# Altium schematic sheet Controller_Section.SchDoc
size A4; SheetNumber: 3; SheetTotal: 5
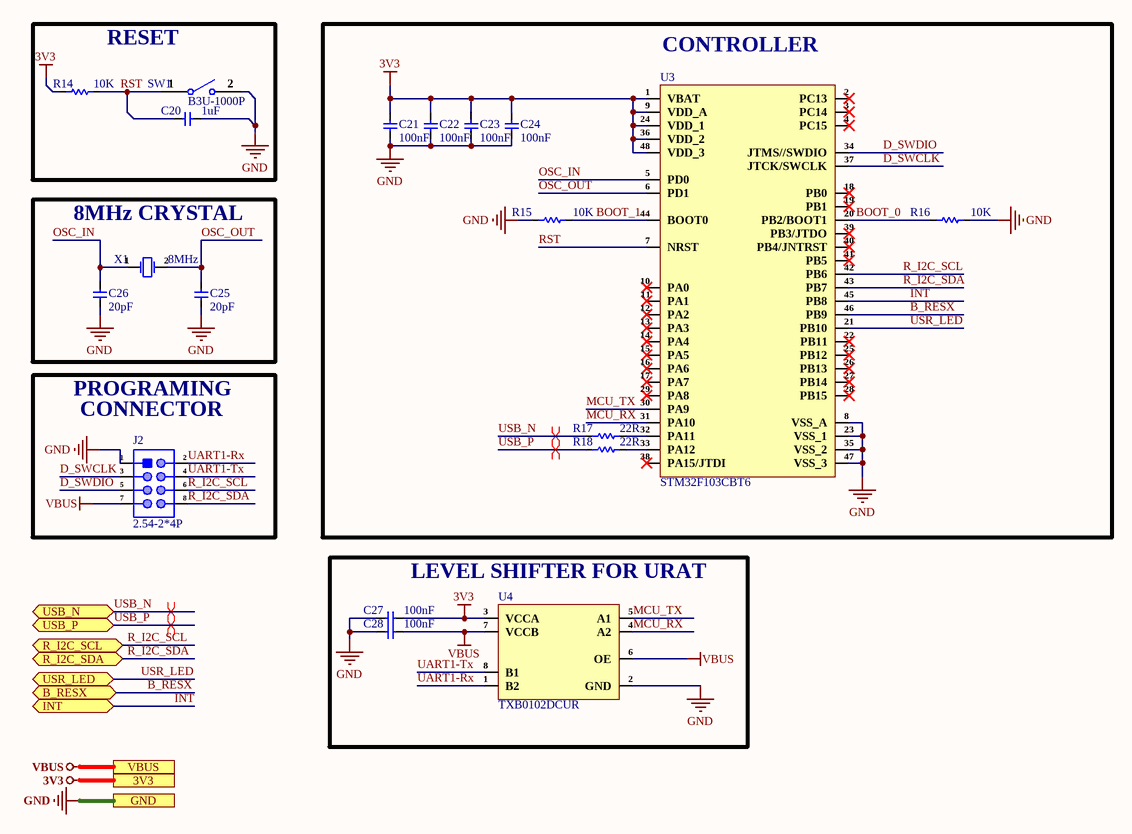
[diagram p0: Controller_Section.SchDoc]

## Parts
C20  1uF  [Cap-0603]
C21  100nF  [Cap-0603]
C22  100nF  [Cap-0603]
C23  100nF  [Cap-0603]
C24  100nF  [Cap-0603]
C25  20pF  [Cap-0603]
C26  20pF  [Cap-0603]
C27  100nF  [Cap-0603]
C28  100nF  [Cap-0603]
J2  2.54-2*4P  [C192300]
R14  10K  [Res-0603]
R15  10K  [Res-0603]
R16  10K  [Res-0603]
R17  22R  [Res-0603]
R18  22R  [Res-0603]
SW1  B3U-1000P  [B3U-1000P]
U3  STM32F103CBT6  [48-LQFP (7x7)_]
U4  TXB0102DCUR  [VSSOP-8(3.1x2.1)]
X1  8MHz  [SMD5032-2P]

## Blocks framed on the sheet
RESET: C20 R14 SW1
CONTROLLER: C21-C24 R15-R18 U3
8MHz CRYSTAL: C25 C26 X1
LEVEL SHIFTER FOR URAT: C27 C28 U4

## Ports
3V3 (see Top_Sheet[2B], HDMI_to_MIPI_Section[1D], Power_Section[3C]), B_RESX (bidir, see Top_Sheet[3B], HDMI_to_MIPI_Section[1C]), GND (see Top_Sheet[3B], Connector_Section[3C], HDMI_to_MIPI_Section[1D], Power_Section[3C]), INT (bidir, see Top_Sheet[3B], HDMI_to_MIPI_Section[1C]), R_I2C_SCL (bidir, see Top_Sheet[3B], HDMI_to_MIPI_Section[1C]), R_I2C_SDA (bidir, see Top_Sheet[3B], HDMI_to_MIPI_Section[1C]), USB_N (bidir, see Top_Sheet[2B], Power_Section[2C]), USB_P (bidir, see Top_Sheet[2B], Power_Section[2C]), USR_LED (bidir, see Top_Sheet[2B], Power_Section[2C]), VBUS (see Top_Sheet[2B], Connector_Section[3C], Power_Section[3C])

## Nets
3V3: C21.2 C22.2 C23.2 C24.2 C27.1 R14.1 U3.1(VBAT) U3.9(VDD_A) U3.24(VDD_1) U3.36(VDD_2) U3.48(VDD_3) U4.3(VCCA) ; port 3V3
GND: C20.2 C21.1 C22.1 C23.1 C24.1 C25.1 C26.1 C27.2 C28.2 J2.1 R15.1 R16.2 SW1.2 U3.8(VSS_A) U3.23(VSS_1) U3.35(VSS_2) U3.47(VSS_3) U4.2(GND) ; port GND
VBUS: C28.1 J2.7 U4.6(OE) U4.7(VCCB) ; port VBUS
B_RESX: U3.46(PB9) ; port B_RESX
BOOT_0: R16.1 U3.20(PB2/BOOT1)
BOOT_1: R15.2 U3.44(BOOT0)
D_SWCLK: J2.3 U3.37(JTCK/SWCLK)
D_SWDIO: J2.5 U3.34(JTMS//SWDIO)
INT: U3.45(PB8) ; port INT
MCU_RX: U3.31(PA10) U4.4(A2)
MCU_TX: U3.30(PA9) U4.5(A1)
OSC_IN: C26.2 U3.5(PD0) X1.1(OSC1)
OSC_OUT: C25.2 U3.6(PD1) X1.2(OSC2)
R_I2C_SCL: J2.6 U3.42(PB6) ; port R_I2C_SCL
R_I2C_SDA: J2.8 U3.43(PB7) ; port R_I2C_SDA
RST: C20.1 R14.2 SW1.1 U3.7(NRST)
UART1-Rx: J2.2 U4.1(B2)
UART1-Tx: J2.4 U4.8(B1)
USB_N: R17.1 ; port USB_N
USB_P: R18.1 ; port USB_P
USR_LED: U3.21(PB10) ; port USR_LED
NetR17_2: R17.2 U3.32(PA11)
NetR18_2: R18.2 U3.33(PA12)

Not connected (* = marked no-connect by the designer): U3 2(PC13)* 3(PC14)* 4(PC15)* 10(PA0)* 11(PA1)* 12(PA2)* 13(PA3)* 14(PA4)* 15(PA5)* 16(PA6)* 17(PA7)* 18(PB0)* 19(PB1)* 22(PB11)* 25(PB12)* 26(PB13)* 27(PB14)* 28(PB15)* 29(PA8)* 38(PA15/JTDI)* 39(PB3/JTDO)* 40(PB4/JNTRST)* 41(PB5)*

## Layout directives
differential pair; net class USB; differential pair class USB_Lines; rule Impedance Constraint [Min = 85.00    Max = 90.00    ]; rule Matched Net Lengths [Tolerance = 50mil]: USB_N, USB_P

## Notes on the sheet
- PROGRAMING
- (near J2) CONNECTOR
- File:
- Title:
- Date:
- Page
- Num:
- Total:
- Drawn By: Huzaifa Ali

## Library data of the parts
C20 = CL10A105KO8NNNC: 16V 1uF X5R ±10% 0603 Multilayer Ceramic Capacitors MLCC - SMD/SMT ROHS; Manufacturer: Samsung Electro-Mechanics; Manufacturer Part Number: CL10A105KO8NNNC; Package: 0603; LCSC Part Number: C1592; Item Type: Capacitor; ComponentLink1Description: LCSC; ComponentLink1URL: https://www.lcsc.com/product-detail/Multilayer-Ceramic-Capacitors-MLCC-SMD-SMT_Samsung-Electro-Mechanics-CL10A105KO8NNNC_C1592.html
C21-C24 C27 C28 = CL10B104KA8NNNC: 25V 100nF X7R ±10% 0603 Multilayer Ceramic Capacitors MLCC - SMD/SMT ROHS; Manufacturer: Samsung Electro-Mechanics; ComponentLink1Description: LCSC; ComponentLink1URL: https://www.lcsc.com/product-detail/Multilayer-Ceramic-Capacitors-MLCC-SMD-SMT_Samsung-Electro-Mechanics-CL10B104KA8NNNC_C1590.html; Manufacturer Part Number: CL10B104KA8NNNC; Package: 0603; LCSC Part Number: C1590; Item Type: Capacitor
C25 C26 = CC0603JRNPO9BN200: CAP CER 20PF 50V C0G/NPO 0603; Manufacturer: Yageo; Tolerance: 5%; Dielectric: C0G; Item Type: Capacitor; Supplier 1: Digi-Key; Manufacturer Part Number: CC0603JRNPO9BN200; Stock 1: 259568; Pricing 1: 1=0.1, 10=0.048, 100=0.0214, 500=0.01526, 1000=0.01198 (USD); Mount: Surface Mount; Case/Package: 0603; Number of Pins: 2; Weight: 7.1E-05oz; Case Code (Imperial): 0603; Case Code (Metric): 1608; Min Operating Temperature: -55°C; Max Operating Temperature: 125°C; Capacitance: 20pF; Package Quantity: 4000; Voltage Rating (DC): 50V; Packaging: Tape and Reel; Voltage Rating: 50V; Termination: SMD/SMT; Composition: Ceramic; Length: 1.6mm; Width: 0.8mm; Thickness: 0.035inch; Depth: 0.8mm; REACH SVHC: Unknown; Lead Free: Lead Free; ComponentLink1URL: http://www.farnell.com/datasheets/1132289.pdf?src-supplier=Element14; ComponentLink1Description: http://www.farnell.com/datasheets/1132289.pdf?src-supplier=Element14; ComponentLink2URL: http://www.yageo.com/documents/recent/UPY-GP_NP0_16V-to-50V_16.pdf?src-supplier=Digi-Key; ComponentLink2Description: http://www.yageo.com/documents/recent/UPY-GP_NP0_16V-to-50V_16.pdf?src-supplier=Digi-Key; Supplier Part Number 1: 311-1424-6-ND; LCSC Part Number: C105621
J2 = 2.54-2*4P: 3A Brick nogging Square Pins 2.5mm 8P 6mm -55℃~+105℃ 2.54mm 双排 Black 2x4P 2.54mm SMD,P=2.54mm Pin Headers ROHS; Manufacturer: BOOMELE(BOOM Precision Elec); Item Type: Male; Manufacturer Part Number: 2.54-2*4P; Package: SMD,P=2.54mm; LCSC Part Number: C192300; ComponentLink1Description: LCSC; ComponentLink1URL: https://www.lcsc.com/product-detail/Pin-Headers_BOOMELE-Boom-Precision-Elec-C192300_C192300.html
R14-R16 = 0603WAF1002T5E: 100mW Thick Film Resistors 75V ±100ppm/℃ ±1% 10kΩ 0603 Chip Resistor - Surface Mount ROHS; Manufacturer: UNI-ROYAL(Uniroyal Elec); Manufacturer Part Number: 0603WAF1002T5E; Value: 10K; Package: 0603; ComponentLink1Description: LCSC; ComponentLink1URL: https://www.lcsc.com/product-detail/Chip-Resistor-Surface-Mount_UNI-ROYAL-Uniroyal-Elec-0603WAF1002T5E_C25804.html; LCSC Part Number: C25804; Item Type: Resistor
R17 R18 = 0603WAF220JT5E: 100mW Thick Film Resistors 75V ±100ppm/℃ ±1% 22Ω 0603 Chip Resistor - Surface Mount ROHS; Manufacturer: UNI-ROYAL(Uniroyal Elec); Manufacturer Part Number: 0603WAF220JT5E; Value: 22R; Footprint: 0603; ComponentLink1Description: LCSC; ComponentLink1URL: https://www.lcsc.com/product-detail/Chip-Resistor-Surface-Mount_UNI-ROYAL-Uniroyal-Elec-0603WAF220JT5E_C23345.html; LCSC Part Number: C23345; Item Type: Resistor
SW1 = B3U-1000P: SWITCH TACTILE SPST-NO 0.05A 12V; Manufacturer: Omron; Mechanical Life: 200000Cycles; Operating Force: 1.5N; Throw Configuration: SPST; Current Rating: 50mA; Contact Resistance: 100mR; Illumination Type: Non-Illuminated,Illuminated; Switch Travel: 0.15mm; Switch Function: Off-Mom; Actuator Type: Standard; Actuator Length: 0.4mm; Ratings: Dust Proof,IP40; ComponentLink1URL: http://www.farnell.com/datasheets/60838.pdf?src-supplier=Farnell; ComponentLink1Description: http://www.farnell.com/datasheets/60838.pdf?src-supplier=Farnell; ComponentLink2URL: http://www.farnell.com/datasheets/60838.pdf?src-supplier=Element14; ComponentLink2Description: http://www.farnell.com/datasheets/60838.pdf?src-supplier=Element14; ComponentLink3URL: https://omronfs.omron.com/en_US/ecb/products/pdf/en-b3u.pdf?src-supplier=Digi-Key; ComponentLink3Description: https://omronfs.omron.com/en_US/ecb/products/pdf/en-b3u.pdf?src-supplier=Digi-Key; ComponentLink4URL: http://www.omron.com/ecb/products/pdf/en-b3u.pdf?src-supplier=Digi-Key; ComponentLink4Description: http://www.omron.com/ecb/products/pdf/en-b3u.pdf?src-supplier=Digi-Key; ComponentLink5URL: https://www.distrelec.biz/Web/Downloads/he/et/B3U_eng_datasheet.pdf?mime=application%2Fpdf&src-supplier=Distrelec; ComponentLink5Description: https://www.distrelec.biz/Web/Downloads/he/et/B3U_eng_datasheet.pdf?mime=application%2Fpdf&src-supplier=Distrelec; ComponentLink6URL: http://www.onlinecomponents.com/productFiles/mf-OM/en-b3u.pdf?src-supplier=Onlinecomponents.com; ComponentLink6Description: http://www.onlinecomponents.com/productFiles/mf-OM/en-b3u.pdf?src-supplier=Onlinecomponents.com; Supplier 1: Digi-Key; Manufacturer Part Number: B3U-1000P; Stock 1: 116454; Pricing 1: 1=1, 10=0.961, 25=0.9064, 50=0.7976, 100=0.7251, 250=0.68888, 500=0.67074, 1000=0.52571 (USD); Mount: Surface Mount; Weight: 0.000776oz; Contact Material: Silver; Min Operating Temperature: -25°C; Max Operating Temperature: 70°C; Packaging: Tape and Reel; Voltage Rating (DC): 12V; Package Quantity: 1; Max Current Rating: 50mA; Termination: SMD/SMT; Orientation: Straight; Max Voltage Rating (DC): 12V; Electrical Life: 200000Cycles; Insulation Resistance: 100MR; Contact Current Rating: 50mA; Length: 4mm; Height: 1.2mm; Depth: 2.5mm; Width: 3mm; REACH SVHC: Unknown; Lead Free: Lead Free; ComponentLink7URL: https://www.verical.com/server-webapp/html/getDatasheet?partID=552554&src-supplier=Verical; ComponentLink7Description: https://www.verical.com/server-webapp/html/getDatasheet?partID=552554&src-supplier=Verical; ComponentLink8URL: http://www.farnell.com/datasheets/1685550.pdf?src-supplier=Element14; ComponentLink8Description: http://www.farnell.com/datasheets/1685550.pdf?src-supplier=Element14; ComponentLink9URL: http://www.farnell.com/datasheets/2610940.pdf?src-supplier=Farnell; ComponentLink9Description: http://www.farnell.com/datasheets/2610940.pdf?src-supplier=Farnell; ComponentLink10URL: https://www.alliedelec.com/m/d/4c8a9ef82804fc3c241a13c1e298fd73.pdf?src-supplier=Allied+Electronics; ComponentLink10Description: https://www.alliedelec.com/m/d/4c8a9ef82804fc3c241a13c1e298fd73.pdf?src-supplier=Allied+Electronics; Supplier Part Number 1: SW1020DKR-ND; LCSC Part Number: C231329; Item Type: Switch
U3 = STM32F103CBT6: IC MCU 32BIT 128KB FLASH 48LQFP; Manufacturer: STMicroelectronics; RAM Size: 20KB; Max Power Dissipation: 363mW; Interface: I2C,SPI,USB,CAN,IrDA,UART,USART,LIN; Number of I/Os: 37; Number of Timers/Counters: 4; Max Supply Voltage: 3.6V; Number of PWM Channels: 12; Frequency: 72MHz; Number of ADC Channels: 10; Min Supply Voltage: 2V; Oscillator Type: Internal; Data Bus Width: 32b; Number of Bits: 32; Number of SPI Channels: 2; Watchdog Timer: Yes; Peripherals: POR,PWM,WDT,DMA,Temp Sensor,I2C; Core Architecture: ARM; Supplier: Mouser; Supplier Part Number: 511-STM32F103CBT6; Manufacturer Part Number: STM32F103CBT6; RoHS: Yes; Category: Microcontrollers; Stock: 3552; Pricing: 1=7.35, 10=6.65, 50=5.53, 100=5.49, 1000=4.31, 10000=4.25 (USD); Case/Package: LQFP; Pins: 48; Min Operating Temperature: -40°C; Max Operating Temperature: 85°C; Package Quantity: 250; Density: 128KB; Packaging: Tray; Number of Programmable I/O: 37; Clock Frequency: 72MHz; Number of I2C Channels: 2; Memory Format: FLASH; Termination: SMD/SMT; Address Bus Width: 32b; Memory Size: 128KB; Series: STM32 F1; Length: 7mm; Width: 7.2mm; Height: 1.45mm; Radiation Hardening: No; Reach SVHC Compliant: No; Lead Free: Lead Free; RoHS Compliant: Yes; ComponentLink1URL: https://datasheet.ciiva.com/23669/1714663-23669200.pdf?src-supplier=Newark; ComponentLink1Description: https://datasheet.ciiva.com/23669/1714663-23669200.pdf?src-supplier=Newark; ComponentLink2URL: https://datasheet.ciiva.com/15122/getdatasheetpartid-92132-15122195.pdf?src-supplier=Verical; ComponentLink2Description: https://datasheet.ciiva.com/15122/getdatasheetpartid-92132-15122195.pdf?src-supplier=Verical; ComponentLink3URL: https://datasheet.ciiva.com/5752/cd00161566-5752838.pdf?src-supplier=Farnell; ComponentLink3Description: https://datasheet.ciiva.com/5752/cd00161566-5752838.pdf?src-supplier=Farnell; ComponentLink4URL: https://datasheet.ciiva.com/14100/pustm-arm-microcont-stm32f103-en-14100509.pdf?src-supplier=Distrelec; ComponentLink4Description: https://datasheet.ciiva.com/14100/pustm-arm-microcont-stm32f103-en-14100509.pdf?src-supplier=Distrelec; ComponentLink5URL: https://datasheet.ciiva.com/1502/cd00161566-1502328.pdf?src-supplier=Digi-Key; ComponentLink5Description: https://datasheet.ciiva.com/1502/cd00161566-1502328.pdf?src-supplier=Digi-Key; ComponentLink6URL: https://datasheet.ciiva.com/4840/cd00161566-4840398.pdf?src-supplier=Mouser; ComponentLink6Description: https://datasheet.ciiva.com/4840/cd00161566-4840398.pdf?src-supplier=Mouser; ComponentLink7URL: https://datasheet.ciiva.com/16219/cd00161566-16219150.pdf?src-supplier=Future+Electronics; ComponentLink7Description: https://datasheet.ciiva.com/16219/cd00161566-16219150.pdf?src-supplier=Future+Electronics; Item Type: IC; LCSC Part Number: C8304
U4 = TXB0102DCUR: IC TRANSLTR BIDIRECTIONAL 8VSSOP; Manufacturer: Texas Instruments; Number of Circuits: 1; Nominal Supply Current: 3.5uA; Number of Inputs: 1NUMBER; Max Supply Voltage: 5.5V; Min Supply Voltage: 1.2V; Propagation Delay: 7.4ns; Data Rate: 100Mbps; Logic Function: Translator; Number of Bits: 2; Turn-On Delay Time: 31ns; High Level Output Current: -20uA; Low Level Output Current: 20uA; Output Type: 3-STATE; Supplier: Digikey; Supplier Part Number: 296-22862-1-ND; Manufacturer Part Number: TXB0102DCUR; RoHS: Yes; Category: Voltage Level Shifters; Stock: 10593; Pricing: 1=0.69, 10=0.606, 25=0.5696, 100=0.4649, 250=0.4318, 500=0.36748, 1000=0.29398 (USD); Mounting Technology: Surface Mount; Case/Package: VSSOP; Pins: 8; Weight: 0.000339oz; Min Operating Temperature: -40°C; Max Operating Temperature: 85°C; Number of Outputs: 1NUMBER; Packaging: Tape and Reel; Package Quantity: 3000; Series: -; Channel Type: Bidirectional; Length: 2.3mm; Width: 2mm; Height: 900um; Thickness: 850um; Radiation Hardening: No; Reach SVHC Compliant: No; Lead Free: Lead Free; RoHS Compliant: Yes; ComponentLink1URL: https://datasheet.ciiva.com/7744/1634161-7744195.pdf?src-supplier=Element14; ComponentLink1Description: https://datasheet.ciiva.com/7744/1634161-7744195.pdf?src-supplier=Element14; ComponentLink2URL: https://datasheet.ciiva.com/22677/1699360-22677930.pdf?src-supplier=Element14; ComponentLink2Description: https://datasheet.ciiva.com/22677/1699360-22677930.pdf?src-supplier=Element14; ComponentLink3URL: https://datasheet.ciiva.com/4226/sces641b-4226960.pdf?src-supplier=Arrow+Electronics; ComponentLink3Description: https://datasheet.ciiva.com/4226/sces641b-4226960.pdf?src-supplier=Arrow+Electronics; ComponentLink4URL: https://datasheet.ciiva.com/15096/getdatasheetpartid-214907-15096235.pdf?src-supplier=Verical; ComponentLink4Description: https://datasheet.ciiva.com/15096/getdatasheetpartid-214907-15096235.pdf?src-supplier=Verical; ComponentLink5URL: https://datasheet.ciiva.com/6132/txb0102-6132717.pdf?src-supplier=Farnell; ComponentLink5Description: https://datasheet.ciiva.com/6132/txb0102-6132717.pdf?src-supplier=Farnell; ComponentLink6URL: https://datasheet.ciiva.com/46384/1874809-46384198.pdf?src-supplier=Element14; ComponentLink6Description: https://datasheet.ciiva.com/46384/1874809-46384198.pdf?src-supplier=Element14; ComponentLink7URL: https://datasheet.ciiva.com/1899/txb0102-1899430.pdf?src-supplier=Digikey; ComponentLink7Description: https://datasheet.ciiva.com/1899/txb0102-1899430.pdf?src-supplier=Digikey; ComponentLink8URL: https://datasheet.ciiva.com/1899/txb0102-1899429.pdf?src-supplier=Digikey; ComponentLink8Description: https://datasheet.ciiva.com/1899/txb0102-1899429.pdf?src-supplier=Digikey; ComponentLink9URL: https://datasheet.ciiva.com/1899/txb0102-1899431.pdf?src-supplier=Digikey; ComponentLink9Description: https://datasheet.ciiva.com/1899/txb0102-1899431.pdf?src-supplier=Digikey; ComponentLink10URL: https://datasheet.ciiva.com/14287/txb0102-14287496.pdf?src-supplier=Avnet; ComponentLink10Description: https://datasheet.ciiva.com/14287/txb0102-14287496.pdf?src-supplier=Avnet; LCSC Part Number: C60709; Type: IC; ComponentLink11Description: LCSC; ComponentLink11URL: https://www.lcsc.com/product-detail/Translators-Level-Shifters_Texas-Instruments-TXB0102DCUR_C60709.html
X1 = X50328MSB2GI: 8MHz 20pF ±10ppm ±50ppm SMD5032-2P Crystals ROHS; Manufacturer: Yangxing Tech; Manufacturer Part Number: X50328MSB2GI; Package: SMD5032-2P; LCSC Part Number: C115962; Item Type: Crystal; ComponentLink1Description: LCSC; ComponentLink1URL: https://www.lcsc.com/product-detail/Crystals_Yangxing-Tech-X50328MSB2GI_C115962.html